# Altium schematic sheet FUTURE_USE_CONNECTOR.SchDoc
size A4; SheetNumber: 10; SheetTotal: 20
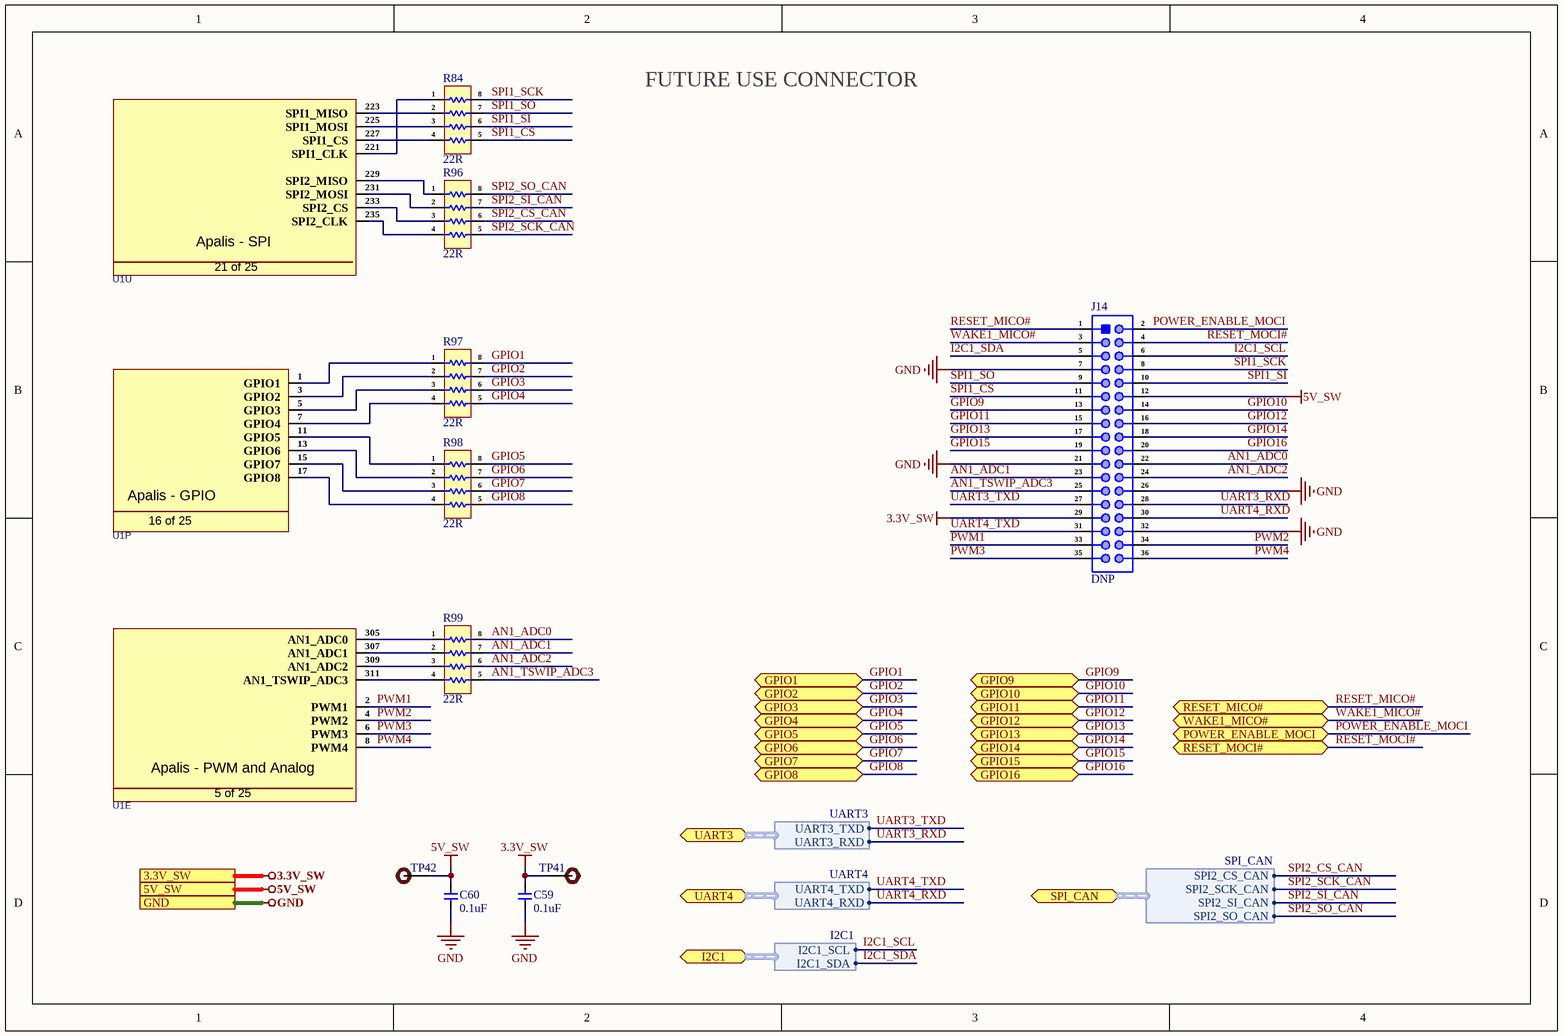
[diagram p0: FUTURE_USE_CONNECTOR.SchDoc]

## Parts
C59  0.1uF  [Cap-0402]
C60  0.1uF  [Cap-0402]
J14  DNP  [ESHF-118-01-L-D-SM-TR]
R84  22R  [YC164-JR-0722RL]
R96  22R  [YC164-JR-0722RL]
R97  22R  [YC164-JR-0722RL]
R98  22R  [YC164-JR-0722RL]
R99  22R  [YC164-JR-0722RL]
TP41  DNP  [Test-point]  (value not drawn)
TP42  DNP  [Test-point]  (value not drawn)
U1  MM70-314B1-2-R300  [MM70-314B1-2-R300]  (value not drawn)  (parts E,P,U of 25)

## Ports
3.3V_SW (see Top_Sheet[2A], DIGITAL_I-O_O-P[1D], ETHERNET_INTERFACE[1D], HDMI_INTERFACE[1D], I2C_INTERFACE[1B], MICRO_SD_CARD_INTERFACE[1D], UART_INTERFACE[1D]), 5V_SW (see Top_Sheet[2A], APALIS_POWER_SUPPLY[1D], CODEC_INTERFACE[1D], HDMI_INTERFACE[1D], LTE_MODULE[1D], USB3.0_INTERFACE[1D]), GND (see Top_Sheet[2A], 03-CAN2_SPI_CAN_CONTROLLER[1D], APALIS_POWER_SUPPLY[1D], CAN2_SPI_CAN_CONTROLLER[1D], CODEC_INTERFACE[1D], CONNECTORS[1D], DC_DC_CONVERTER[1D], DIGITAL_I-O_O-P[1D], ETHERNET_INTERFACE[1D], GPIO_NC_INTERFACE[4B], HDMI_INTERFACE[1D], I2C_INTERFACE[1B], INPUT_SUPPLY_PROTECTION[1D], LTE_MODULE[1D], MECHANICAL_FOR_PCB[1D], MICRO_SD_CARD_INTERFACE[1D], Reset_and_SDIO[1D], UART_INTERFACE[1D], USB3.0_INTERFACE[1D]), GPIO1 (bidir, see Top_Sheet[3B], DIGITAL_I-O_O-P[1C]), GPIO2 (bidir, see Top_Sheet[3B], DIGITAL_I-O_O-P[1C]), GPIO3 (bidir, see Top_Sheet[3B], DIGITAL_I-O_O-P[1C]), GPIO4 (bidir, see Top_Sheet[3B], DIGITAL_I-O_O-P[1C]), GPIO5 (bidir, see Top_Sheet[2A], CONNECTORS[2D]), GPIO6 (bidir, see Top_Sheet[2A], CONNECTORS[2D]), GPIO7 (bidir, see Top_Sheet[2A], CONNECTORS[2D]), GPIO8 (bidir, see Top_Sheet[2A], CONNECTORS[2D]), GPIO9 (bidir, see Top_Sheet[2A], CONNECTORS[2D], GPIO_NC_INTERFACE[1D]), GPIO10 (bidir, see Top_Sheet[2A], GPIO_NC_INTERFACE[1D]), GPIO11 (bidir, see Top_Sheet[2B], CONNECTORS[2D], GPIO_NC_INTERFACE[3B]), GPIO12 (bidir, see Top_Sheet[2B], CONNECTORS[2D], GPIO_NC_INTERFACE[3B]), GPIO13 (bidir, see Top_Sheet[2B], CONNECTORS[2D], GPIO_NC_INTERFACE[3B]), GPIO14 (bidir, see Top_Sheet[2B], GPIO_NC_INTERFACE[2A]), GPIO15 (bidir, see Top_Sheet[2B], GPIO_NC_INTERFACE[2A]), GPIO16 (bidir, see Top_Sheet[3B], GPIO_NC_INTERFACE[2A]), I2C1 (bidir, harness I2C1, see Top_Sheet[3A], CONNECTORS[2C], I2C_INTERFACE[4B]), POWER_ENABLE_MOCI (bidir, see Top_Sheet[3A], Reset_and_SDIO[3D]), RESET_MICO# (bidir, see Top_Sheet[3A], Reset_and_SDIO[3D]), RESET_MOCI# (bidir, see Top_Sheet[3A], Reset_and_SDIO[3D]), SPI_CAN (bidir, harness SPI_CAN, see Top_Sheet[2B], CAN2_SPI_CAN_CONTROLLER[3D]), UART3 (bidir, harness UART3, see Top_Sheet[2B], UART_INTERFACE[3D]), UART4 (bidir, harness UART4, see Top_Sheet[2B], UART_INTERFACE[3D]), WAKE1_MICO# (bidir, see Top_Sheet[3A], I2C_INTERFACE[2B], Reset_and_SDIO[3D])

## Harnesses
I2C1: I2C1_SCL, I2C1_SDA
UART3: UART3_TXD, UART3_RXD
UART4: UART4_TXD, UART4_RXD
SPI_CAN: SPI2_CS_CAN, SPI2_SCK_CAN, SPI2_SI_CAN, SPI2_SO_CAN

## Nets
3.3V_SW: C59.2 J14.29 TP41.1 ; port 3.3V_SW
5V_SW: C60.2 J14.12 TP42.1 ; port 5V_SW
GND: C59.1 C60.1 J14.7 J14.21 J14.26 J14.32 ; port GND
AN1_ADC0: J14.22 R99.8
AN1_ADC1: J14.23 R99.7
AN1_ADC2: J14.24 R99.6
AN1_TSWIP_ADC3: J14.25 R99.5
GPIO1: R97.8 ; port GPIO1
GPIO2: R97.7 ; port GPIO2
GPIO3: R97.6 ; port GPIO3
GPIO4: R97.5 ; port GPIO4
GPIO5: R98.8 ; port GPIO5
GPIO6: R98.7 ; port GPIO6
GPIO7: R98.6 ; port GPIO7
GPIO8: R98.5 ; port GPIO8
GPIO9: J14.13 ; port GPIO9
GPIO10: J14.14 ; port GPIO10
GPIO11: J14.15 ; port GPIO11
GPIO12: J14.16 ; port GPIO12
GPIO13: J14.17 ; port GPIO13
GPIO14: J14.18 ; port GPIO14
GPIO15: J14.19 ; port GPIO15
GPIO16: J14.20 ; port GPIO16
I2C1_SCL: J14.6 ; port I2C1.I2C1_SCL
I2C1_SDA: J14.5 ; port I2C1.I2C1_SDA
POWER_ENABLE_MOCI: J14.2 ; port POWER_ENABLE_MOCI
PWM1: J14.33 U1.2(PWM1)
PWM2: J14.34 U1.4(PWM2)
PWM3: J14.35 U1.6(PWM3)
PWM4: J14.36 U1.8(PWM4)
RESET_MICO#: J14.1 ; port RESET_MICO#
RESET_MOCI#: J14.4 ; port RESET_MOCI#
SPI1_CS: J14.11 R84.5
SPI1_SCK: J14.8 R84.8
SPI1_SI: J14.10 R84.6
SPI1_SO: J14.9 R84.7
SPI2_CS_CAN: R96.6 ; port SPI_CAN.SPI2_CS_CAN
SPI2_SCK_CAN: R96.5 ; port SPI_CAN.SPI2_SCK_CAN
SPI2_SI_CAN: R96.7 ; port SPI_CAN.SPI2_SI_CAN
SPI2_SO_CAN: R96.8 ; port SPI_CAN.SPI2_SO_CAN
UART3_RXD: J14.28 ; port UART3.UART3_RXD
UART3_TXD: J14.27 ; port UART3.UART3_TXD
UART4_RXD: J14.30 ; port UART4.UART4_RXD
UART4_TXD: J14.31 ; port UART4.UART4_TXD
WAKE1_MICO#: J14.3 ; port WAKE1_MICO#
NetR84_1: R84.1 U1.221(SPI1_CLK)
NetR84_2: R84.2 U1.223(SPI1_MISO)
NetR84_3: R84.3 U1.225(SPI1_MOSI)
NetR84_4: R84.4 U1.227(SPI1_CS)
NetR96_1: R96.1 U1.229(SPI2_MISO)
NetR96_2: R96.2 U1.231(SPI2_MOSI)
NetR96_3: R96.3 U1.233(SPI2_CS)
NetR96_4: R96.4 U1.235(SPI2_CLK)
NetR97_1: R97.1 U1.1(GPIO1)
NetR97_2: R97.2 U1.3(GPIO2)
NetR97_3: R97.3 U1.5(GPIO3)
NetR97_4: R97.4 U1.7(GPIO4)
NetR98_1: R98.1 U1.11(GPIO5)
NetR98_2: R98.2 U1.13(GPIO6)
NetR98_3: R98.3 U1.15(GPIO7)
NetR98_4: R98.4 U1.17(GPIO8)
NetR99_1: R99.1 U1.305(AN1_ADC0)
NetR99_2: R99.2 U1.307(AN1_ADC1)
NetR99_3: R99.3 U1.309(AN1_ADC2)
NetR99_4: R99.4 U1.311(AN1_TSWIP_ADC3)

## Notes on the sheet
- FUTURE USE CONNECTOR
- (in symbol MM70-314B1-2-R300, part E) Apalis - PWM and Analog; 5 of 25
- (in symbol MM70-314B1-2-R300, part P) Apalis - GPIO; 16 of 25
- (in symbol MM70-314B1-2-R300, part U) Apalis - SPI; 21 of 25

## Library data of the parts
C59 C60 = C0402C104K4REC7867: Cap Cer 0402 0.1UF 16V X7R 10%; Manufacturer: KEMET; Item Type: Capacitor; Supplier: Digi-Key; Supplier Part Number: 399-C0402C104K4REC7867CT-ND; Manufacturer Part Number: C0402C104K4REC7867; RoHS: No; Category: Ceramic Capacitors; Stock: 10918; Pricing: 1=0.1, 10=0.072, 50=0.0408, 100=0.0338, 500=0.02372, 1000=0.01963, 2500=0.01827, 5000=0.01672 (USD)
J14 = ESHF-118-01-L-D-SM-TR: CONN HEADER SMD 36POS 1.27MM; Manufacturer: Samtec; Supplier: Digi-Key; Supplier Part Number: ESHF-118-01-L-D-SM-TR-ND; Manufacturer Part Number: ESHF-118-01-L-D-SM-TR; RoHS: Yes; Category: Connectors; Pricing: 375=5.42571 (USD); RoHS Compliant: No
R84 R96-R99 = YC164-JR-0722RL: RES ARRAY 4 RES 22 OHM 1206; Manufacturer: Yageo; Supplier: Future Electronics; Supplier Part Number: 4472155; Manufacturer Part Number: YC164-JR-0722RL; RoHS: Yes; Category: Resistor Arrays; Stock: 225000; Pricing: 5000=0.0084, 20000=0.008, 50000=0.0078, 125000=0.0075, 200000=0.0071 (USD); ComponentLink1URL: https://datasheet.ciiva.com/8018/443424-8018007.pdf?src-supplier=Element14; ComponentLink1Description: https://datasheet.ciiva.com/8018/443424-8018007.pdf?src-supplier=Element14; ComponentLink2URL: https://datasheet.ciiva.com/8018/443424-8018008.pdf?src-supplier=Element14; ComponentLink2Description: https://datasheet.ciiva.com/8018/443424-8018008.pdf?src-supplier=Element14; ComponentLink3URL: https://datasheet.ciiva.com/2688/pyu-yc-tc164-51-rohs-l-3-2688422.pdf?src-supplier=Digi-Key; ComponentLink3Description: https://datasheet.ciiva.com/2688/pyu-yc-tc164-51-rohs-l-3-2688422.pdf?src-supplier=Digi-Key; ComponentLink4URL: https://datasheet.ciiva.com/2688/pyu-yc-tc164-51-rohs-l-3-2688421.pdf?src-supplier=Digi-Key; ComponentLink4Description: https://datasheet.ciiva.com/2688/pyu-yc-tc164-51-rohs-l-3-2688421.pdf?src-supplier=Digi-Key; ComponentLink5URL: https://datasheet.ciiva.com/8320/pyu-yc-tc164-51-rohs-l-3-8320230.pdf?src-supplier=Avnet; ComponentLink5Description: https://datasheet.ciiva.com/8320/pyu-yc-tc164-51-rohs-l-3-8320230.pdf?src-supplier=Avnet; ComponentLink6URL: https://datasheet.ciiva.com/2688/pyu-yc-tc164-51-rohs-l-3-2688423.pdf?src-supplier=Digi-Key; ComponentLink6Description: https://datasheet.ciiva.com/2688/pyu-yc-tc164-51-rohs-l-3-2688423.pdf?src-supplier=Digi-Key; ComponentLink7URL: https://datasheet.ciiva.com/17030/pyu-yc-tc164-51-rohs-l-3-17030158.pdf?src-supplier=Future+Electronics; ComponentLink7Description: https://datasheet.ciiva.com/17030/pyu-yc-tc164-51-rohs-l-3-17030158.pdf?src-supplier=Future+Electronics; ComponentLink8URL: https://datasheet.ciiva.com/28379/pyu-yc-tc164-51-rohs-l-3-28379358.pdf?; ComponentLink8Description: https://datasheet.ciiva.com/28379/pyu-yc-tc164-51-rohs-l-3-28379358.pdf?
TP41 TP42 = TEST POINT: Test Point ON; Item Type: TEST POINT
U1 = MM70-314B1-2-R300: CONN MXM 3.0 FMALE 314POS 0.020; Manufacturer: JAE Electronics; Supplier: Digi-Key; Supplier Part Number: 670-MM70-314B1-2-R300CT-ND; Manufacturer Part Number: MM70-314B1-2-R300; RoHS: No; Category: Card Edge Connectors; Stock: 4979; Pricing: 1=9.21, 10=8.287, 25=7.8064, 50=7.6064, 100=7.4062 (USD)